# Altium schematic sheet USB.SchDoc
size A3; SheetNumber: 1; SheetTotal: 4
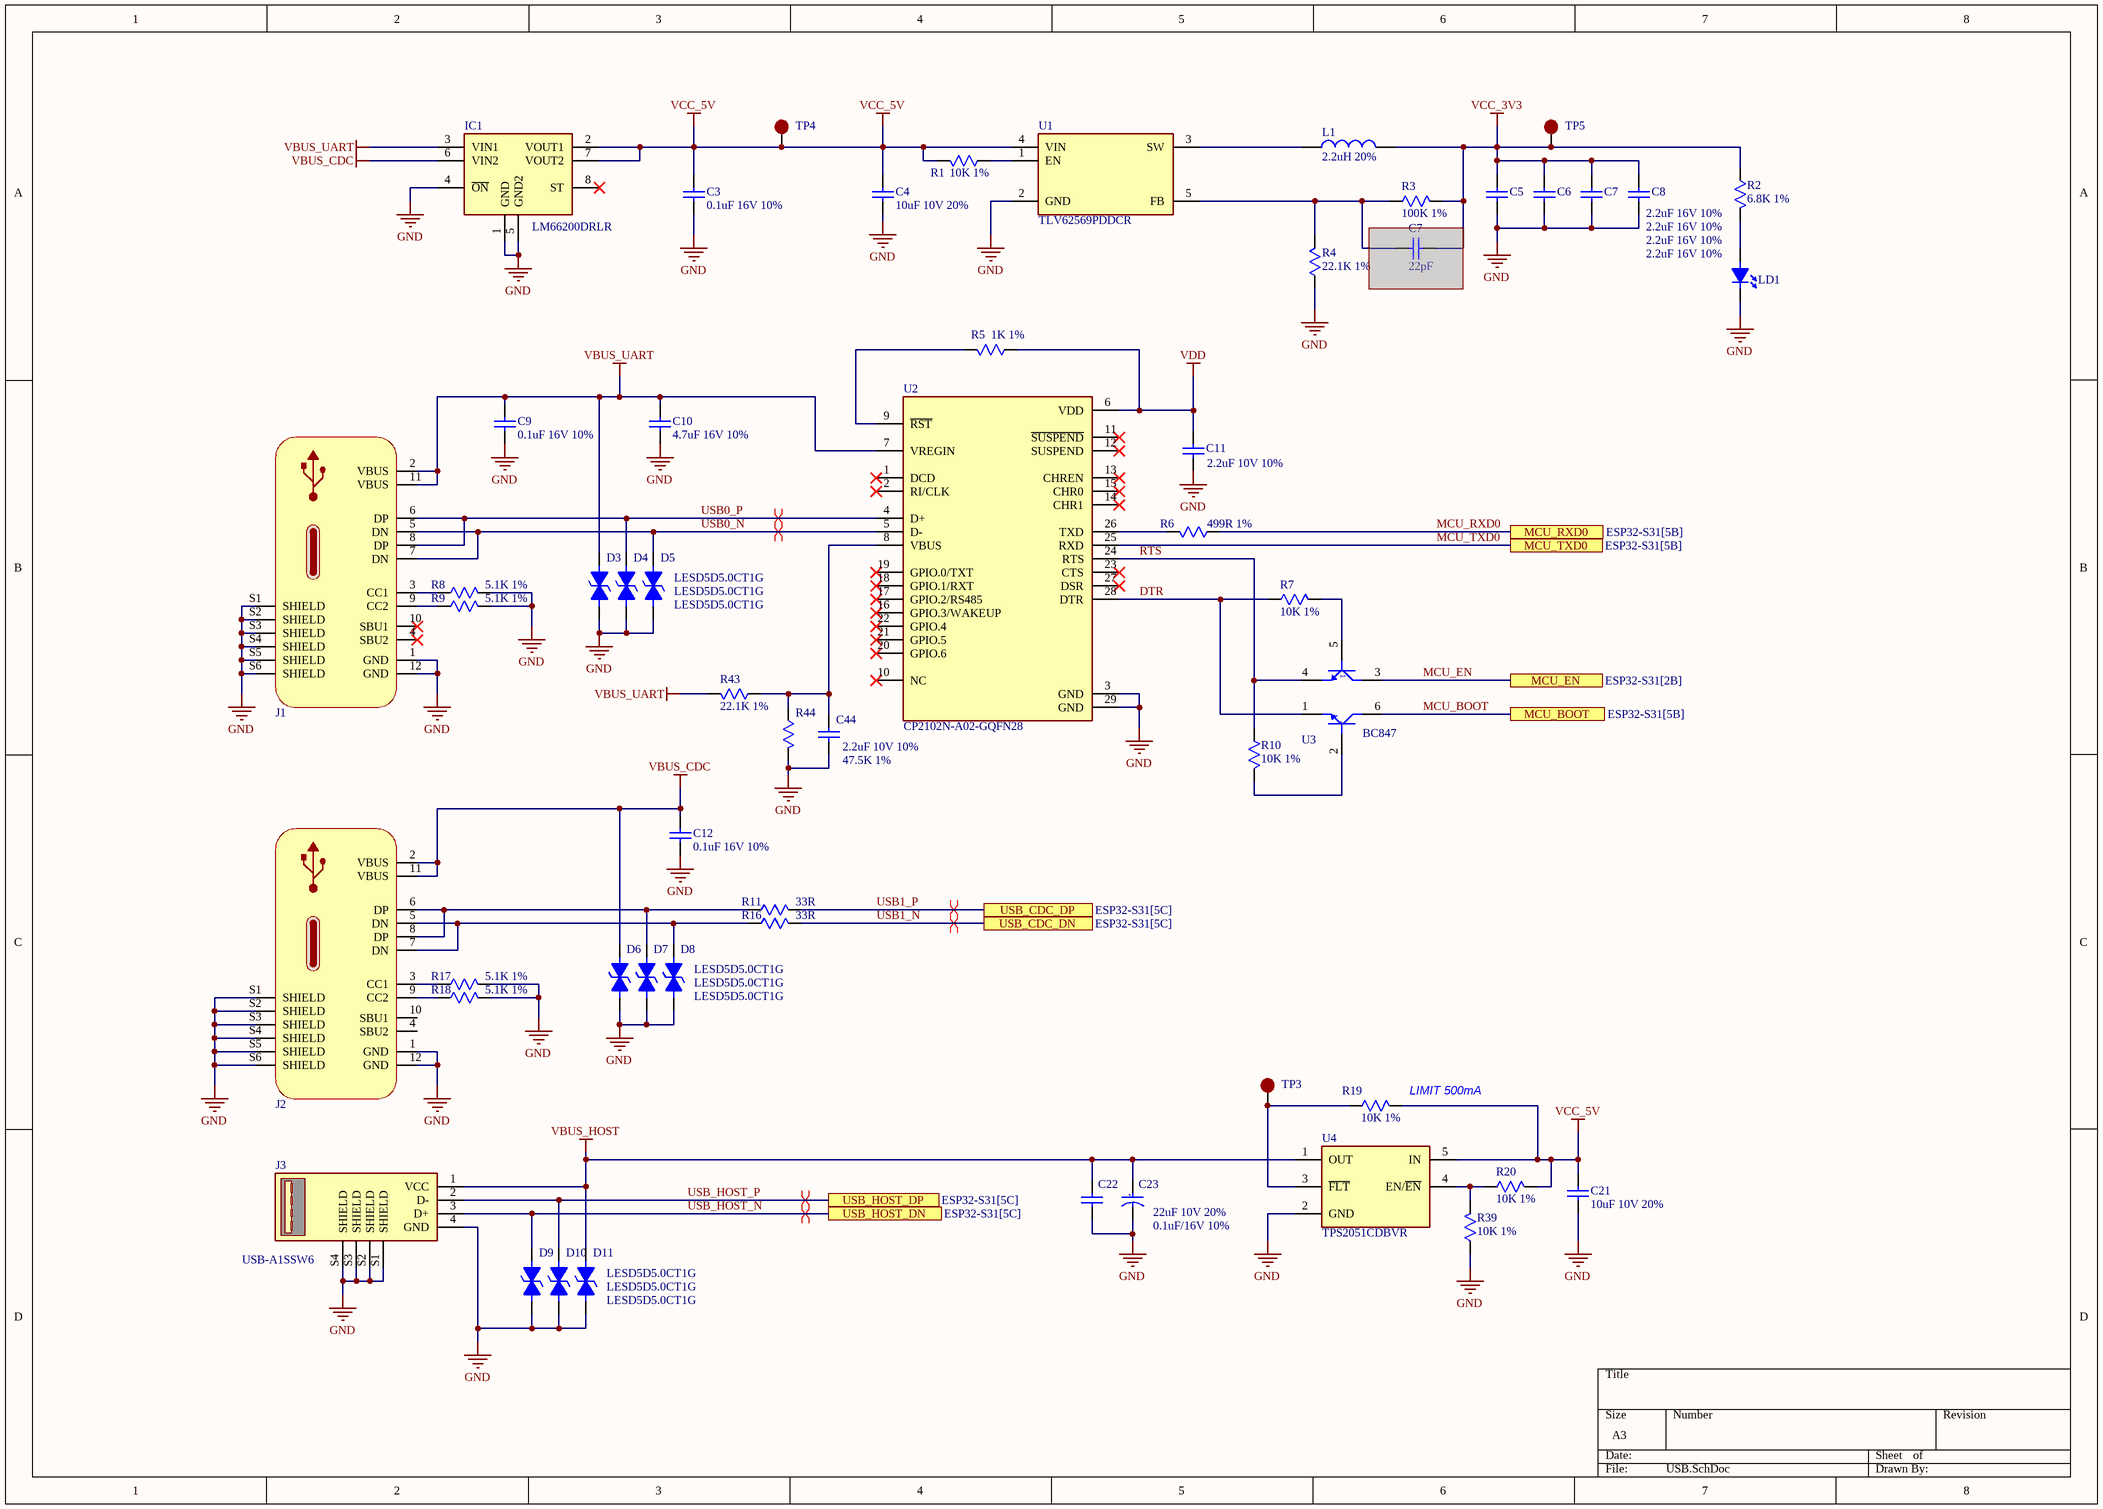
[diagram p0: USB.SchDoc]

## Parts
(Parts that share a designator on the sheet are numbered #1, #2 ... from top to bottom, then left to right.)
C3  0.1uF 16V 10%  [C0402]
C4  10uF 10V 20%  [C0805]
C5  2.2uF 16V 10%  [C0603]
C6  2.2uF 16V 10%  [C0603]
C7#1  2.2uF 16V 10%  [C0603]
C7#2  22pF  [C0402]  (masked out: inside a compile mask, not in the netlist)
C8  2.2uF 16V 10%  [C0603]
C9  0.1uF 16V 10%  [C0402]
C10  4.7uF 16V 10%  [C0603]
C11  2.2uF 10V 10%  [C0402]
C12  0.1uF 16V 10%  [C0603]
C21  10uF 10V 20%  [C0603]
C22  0.1uF/16V 10%  [C0402]
C23  22uF 10V 20%  [C1206P]
C44  2.2uF 10V 10%  [C0402]
D3  LESD5D5.0CT1G  [SOD-523]
D4  LESD5D5.0CT1G  [SOD-523]
D5  LESD5D5.0CT1G  [SOD-523]
D6  LESD5D5.0CT1G  [SOD-523]
D7  LESD5D5.0CT1G  [SOD-523]
D8  LESD5D5.0CT1G  [SOD-523]
D9  LESD5D5.0CT1G  [SOD-523]
D10  LESD5D5.0CT1G  [SOD-523]
D11  LESD5D5.0CT1G  [SOD-523]
IC1  LM66200DRLR  [SOT8]
J1  USB-C  [JAE_DX07S016JA1R1500]  (value not drawn)
J2  USB-C  [JAE_DX07S016JA1R1500]  (value not drawn)
J3  USB-A1SSW6  [USB-A-Vertical]
L1  2.2uH 20%  [IND_ASPI-0530HI-2R2M-T2]
LD1  LED-SMD  [LED0603]  (value not drawn)
R1  10K 1%  [R0402]
R2  6.8K 1%  [R0402]
R3  100K 1%  [R0402]
R4  22.1K 1%  [R0402]
R5  1K 1%  [R0402]
R6  499R 1%  [R0402]
R7  10K 1%  [R0402]
R8  5.1K 1%  [R0402]
R9  5.1K 1%  [R0402]
R10  10K 1%  [R0402]
R11  33R  [R0402]
R16  33R  [R0402]
R17  5.1K 1%  [R0402]
R18  5.1K 1%  [R0402]
R19  10K 1%  [R0402]
R20  10K 1%  [R0402]
R39  10K 1%  [R0402]
R43  22.1K 1%  [R0402]
R44  47.5K 1%  [R0402]
TP3  Test point  [TP]  (value not drawn)
TP4  Test point  [TP]  (value not drawn)
TP5  Test point  [TP]  (value not drawn)
U1  TLV62569PDDCR  [SOT23-5]
U2  CP2102N-A02-GQFN28  [QFN-28]
U3  BC847  [SOT-363]
U4  TPS2051CDBVR  [SOT23-5]

## Ports
MCU_BOOT (see ESP32-S31[5B]), MCU_EN (see ESP32-S31[2B]), MCU_RXD0 (see ESP32-S31[5B]), MCU_TXD0 (see ESP32-S31[5B]), USB_CDC_DN (see ESP32-S31[5C]), USB_CDC_DP (see ESP32-S31[5C]), USB_HOST_DN (see ESP32-S31[5C]), USB_HOST_DP (see ESP32-S31[5C])

## Nets
GND: C3.1 C4.1 C5.2 C6.2 C7#1.2 C8.2 C9.1 C10.1 C11.1 C12.1 C21.1 C22.1 C23.2 C44.1 D3.2(K) D4.2(K) D5.2(K) D6.2(K) D7.2(K) D8.2(K) D9.2(K) D10.2(K) D11.2(K) IC1.1(GND) IC1.4(~{ON}) IC1.5(GND2) J1.1(GND) J1.12(GND) J1.S1(SHIELD) J1.S2(SHIELD) J1.S3(SHIELD) J1.S4(SHIELD) J1.S5(SHIELD) J1.S6(SHIELD) J2.1(GND) J2.12(GND) J2.S1(SHIELD) J2.S2(SHIELD) J2.S3(SHIELD) J2.S4(SHIELD) J2.S5(SHIELD) J2.S6(SHIELD) J3.4(GND) J3.S1(SHIELD) J3.S2(SHIELD) J3.S3(SHIELD) J3.S4(SHIELD) LD1.2 R4.1 R8.2 R9.2 R17.2 R18.2 R39.1 R44.2 U1.2(GND) U2.3(GND) U2.29(GND) U4.2(GND)
VBUS_CDC: C12.2 D6.1(A) IC1.6(VIN2) J2.2(VBUS) J2.11(VBUS)
VBUS_HOST: C22.2 C23.1 D11.1(A) J3.1(VCC) U4.1(OUT)
VBUS_UART: C9.2 C10.2 D3.1(A) IC1.3(VIN1) J1.2(VBUS) J1.11(VBUS) R43.2 U2.7(VREGIN)
VCC_3V3: C5.1 C6.1 C7#1.1 C8.1 L1.2 R2.1 R3.2 TP5.1(EPAD)
VCC_5V: C3.2 C4.2 C21.2 IC1.2(VOUT1) IC1.7(VOUT2) R1.2 R19.2 R20.2 TP4.1(EPAD) U1.4(VIN) U4.5(IN)
VDD: C11.2 R5.1 U2.6(VDD)
DTR: R7.1 U2.28(DTR) U3.1
MCU_BOOT: U3.6 ; port MCU_BOOT
MCU_EN: U3.3 ; port MCU_EN
MCU_RXD0: R6.1 ; port MCU_RXD0
MCU_TXD0: U2.25(RXD) ; port MCU_TXD0
RTS: R10.1 U2.24(RTS) U3.4
USB0_N: D5.1(A) J1.5(DN) J1.7(DN) U2.5(D-)
USB0_P: D4.1(A) J1.6(DP) J1.8(DP) U2.4(D+)
USB1_N: R16.2 ; port USB_CDC_DN
USB1_P: R11.2 ; port USB_CDC_DP
USB_HOST_N: D9.1(A) J3.3(D+) ; port USB_HOST_DN
USB_HOST_P: D10.1(A) J3.2(D-) ; port USB_HOST_DP
NetC44_2: C44.2 R43.1 R44.1 U2.8(VBUS)
NetD7_1: D7.1(A) J2.6(DP) J2.8(DP) R11.1
NetD8_1: D8.1(A) J2.5(DN) J2.7(DN) R16.1
NetJ1_3: J1.3(CC1) R8.1
NetJ1_9: J1.9(CC2) R9.1
NetJ2_3: J2.3(CC1) R17.1
NetJ2_9: J2.9(CC2) R18.1
NetL1_1: L1.1 U1.3(SW)
NetLD1_1: LD1.1 R2.2
NetR1_1: R1.1 U1.1(EN)
NetR3_1: R3.1 R4.2 U1.5(FB)
NetR5_2: R5.2 U2.9(~{RST})
NetR6_2: R6.2 U2.26(TXD)
NetR7_2: R7.2 U3.5
NetR10_2: R10.2 U3.2
NetR19_1: R19.1 TP3.1(EPAD) U4.3(~{FLT})
NetR20_1: R20.1 R39.2 U4.4(EN/~{EN})

Not connected (* = marked no-connect by the designer): IC1 8(ST)*; J1 4(SBU2)* 10(SBU1)*; J2 4(SBU2) 10(SBU1); U2 1(DCD)* 2(RI/CLK)* 10(NC)* 11(~{SUSPEND})* 12(SUSPEND)* 13(CHREN)* 14(CHR1)* 15(CHR0)* 16(GPIO.3/WAKEUP)* 17(GPIO.2/RS485)* 18(GPIO.1/RXT)* 19(GPIO.0/TXT)* 20(GPIO.6)* 21(GPIO.5)* 22(GPIO.4)* 23(CTS)* 27(DSR)*

## Layout directives
differential pair: USB0_N, USB0_P, USB1_N, USB1_P, USB_HOST_N, USB_HOST_P

## Notes on the sheet
- (near R19) LIMIT 500mA
- (in symbol Capacitor_Tantalum) +

## Library data of the parts
C3-C6 C7#1 C7#2 C8-C12 C21 C22 C44 = Capacitor_Ceramic
C23 = Capacitor_Tantalum: MF: KYOCERA AVX; MP: TAJA106K016RNJ; SnapEDA_Link: https://www.snapeda.com/parts/TAJA106K016RNJ/Kyocera/view-part/?ref=snap; Package: Package; Value: *; Check_prices: https://www.snapeda.com/parts/TAJA106K016RNJ/Kyocera/view-part/?ref=eda
D3-D11 = Diode_ESD
IC1 = LM66200DRLR: 1.6-V to 5.5-V, 40-mâ„¦, 2.5-A, low-IQ, dual ideal diode; MF: Texas Instruments; SnapEDA_Link: https://www.snapeda.com/parts/LM66200DRLR/Texas+Instruments/view-part/?ref=snap; Package: None; Value: *; MP: LM66200DRLR; Check_prices: https://www.snapeda.com/parts/LM66200DRLR/Texas+Instruments/view-part/?ref=eda
J1 J2 = USB-C: USB-C (USB TYPE-C) USB 2.0 Receptacle Connector 24 (16+8 Dummy) Position Surface Mount, Right Angle; Through Hole; MP: DX07S016JA1R1500; Package: None; Value: *; Price: None; Availability: Unavailable
J3 = USB-A1SSW6: USB-A (USB TYPE-A) - Receptacle Connector 4 Position Through Hole, Right Angle; MF: On Shore; Value: *; SnapEDA_Link: https://www.snapeda.com/parts/USB-A1SSW6/On+Shore+Technology+Inc./view-part/?ref=snap; Purchase-URL: https://pricing.snapeda.com/search/part/USB-A1SSW6/?ref=eda; Availability: In Stock; Price: None; Package: None; Check_prices: https://www.snapeda.com/parts/USB-A1SSW6/On+Shore+Technology+Inc./view-part/?ref=eda; MP: USB-A1SSW6
L1 = Inductor
R1-R11 R16-R20 R39 R43 R44 = Resistor
U1 = TLV62569PDDCR: 2.5V-5.5V input, 2-A high efficiency step-down buck converter in SOT23 and SOT563 package; MF: Texas Instruments; SnapEDA_Link: https://www.snapeda.com/parts/TLV62569PDDCR/Texas+Instruments/view-part/?ref=snap; Package: SOT-23-THN-6 Texas Instruments; Value: *; MP: TLV62569PDDCR; Check_prices: https://www.snapeda.com/parts/TLV62569PDDCR/Texas+Instruments/view-part/?ref=eda
U2 = CP2102N-A02-GQFN28: USB TO UART BRIDGE, -40 TO 85DEG C; Bridge Type:USB to UART; Supply Voltage Min:3V; Supply Voltage Max:3.6V; Interface Case Style:QFN; No. of Pins:28Pins; Operating Temperature Min:-40Â°C; Operating Temperature Max:85Â°C; Product Range:-; Automotive Quali; MF: Silicon Labs; MP: CP2102NA02GQFN28; SnapEDA_Link: https://www.snapeda.com/parts/CP2102NA02GQFN28/Silicon+Labs/view-part/?ref=snap; Package: None; Value: *; Check_prices: https://www.snapeda.com/parts/CP2102NA02GQFN28/Silicon+Labs/view-part/?ref=eda
U3 = BC847: Bipolar (BJT) Transistor Array 2 NPN (Dual) 45V 100mA 100MHz 380mW Surface Mount SC-88/SC70-6/SOT-363; MF: onsemi; MP: BC847BDW1T1G; SnapEDA_Link: https://www.snapeda.com/parts/BC847BDW1T1G/Onsemi/view-part/?ref=snap; Package: SC-88-6 ON Semiconductor; Value: *; Check_prices: https://www.snapeda.com/parts/BC847BDW1T1G/Onsemi/view-part/?ref=eda
U4 = TPS2051CDBVR: 0.5A loading, 4.5-5.5V, 97mÎ© USB power switch, active-high, output discharge, reverse blocking; MF: Texas Instruments; SnapEDA_Link: https://www.snapeda.com/parts/TPS2051CDBVR/Texas+Instruments/view-part/?ref=snap; Package: SOT-23-5 Texas Instruments; Value: *; MP: TPS2051CDBVR; Check_prices: https://www.snapeda.com/parts/TPS2051CDBVR/Texas+Instruments/view-part/?ref=eda